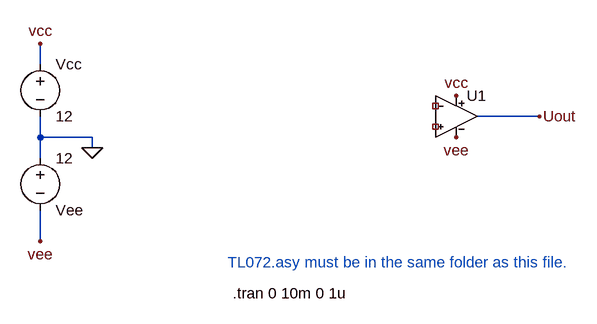
[diagram p0: schematic 5.2_S1_differential_amplifier_student.asc]
5.2_S1_differential_amplifier_student.asc, the LTspice schematic file:
Version 4.1
SHEET 1 1268 600
WIRE -192 176 -192 144
WIRE 576 256 480 256
WIRE -192 288 -192 256
WIRE -112 288 -192 288
WIRE -112 304 -112 288
WIRE -192 320 -192 288
WIRE -192 448 -192 400
FLAG 576 256 Uout
FLAG 448 224 vcc
FLAG 448 288 vee
FLAG -192 144 vcc
FLAG -112 304 0
FLAG -192 448 vee
SYMBOL TL072 448 256 R0
SYMATTR InstName U1
SYMBOL voltage -192 160 R0
SYMATTR InstName Vcc
SYMATTR Value 12
SYMBOL voltage -192 304 R0
WINDOW 0 24 96 Left 2
WINDOW 3 24 16 Left 2
WINDOW 123 0 0 Left 0
WINDOW 39 0 0 Left 0
SYMATTR InstName Vee
SYMATTR Value 12
TEXT 96 480 Left 2 ;TL072.asy must be in the same folder as this file.
TEXT 104 528 Left 2 !.tran 0 10m 0 1u

The netlist it stands for:
* 5.2_S1_differential_amplifier_student.asc
X§U1 NC_01 NC_02 vcc vee Uout level2 Avol=200k GBW=3Meg Slew=13Meg Ilimit=40m Rail=1.5 Vos=0 En=0 Enk=0 In=0 Ink=0 Rin=1T  ; pins In+ In- V+ V- OUT
Vcc vcc 0 12
Vee 0 vee 12
* TL072.asy must be in the same folder as this file.
.tran 0 10m 0 1u
.lib UniversalOpAmp2.lib
.backanno
.end